# Altium schematic sheet vi_dieu_khien.SchDoc
size B; SheetNumber: 2; SheetTotal: 3
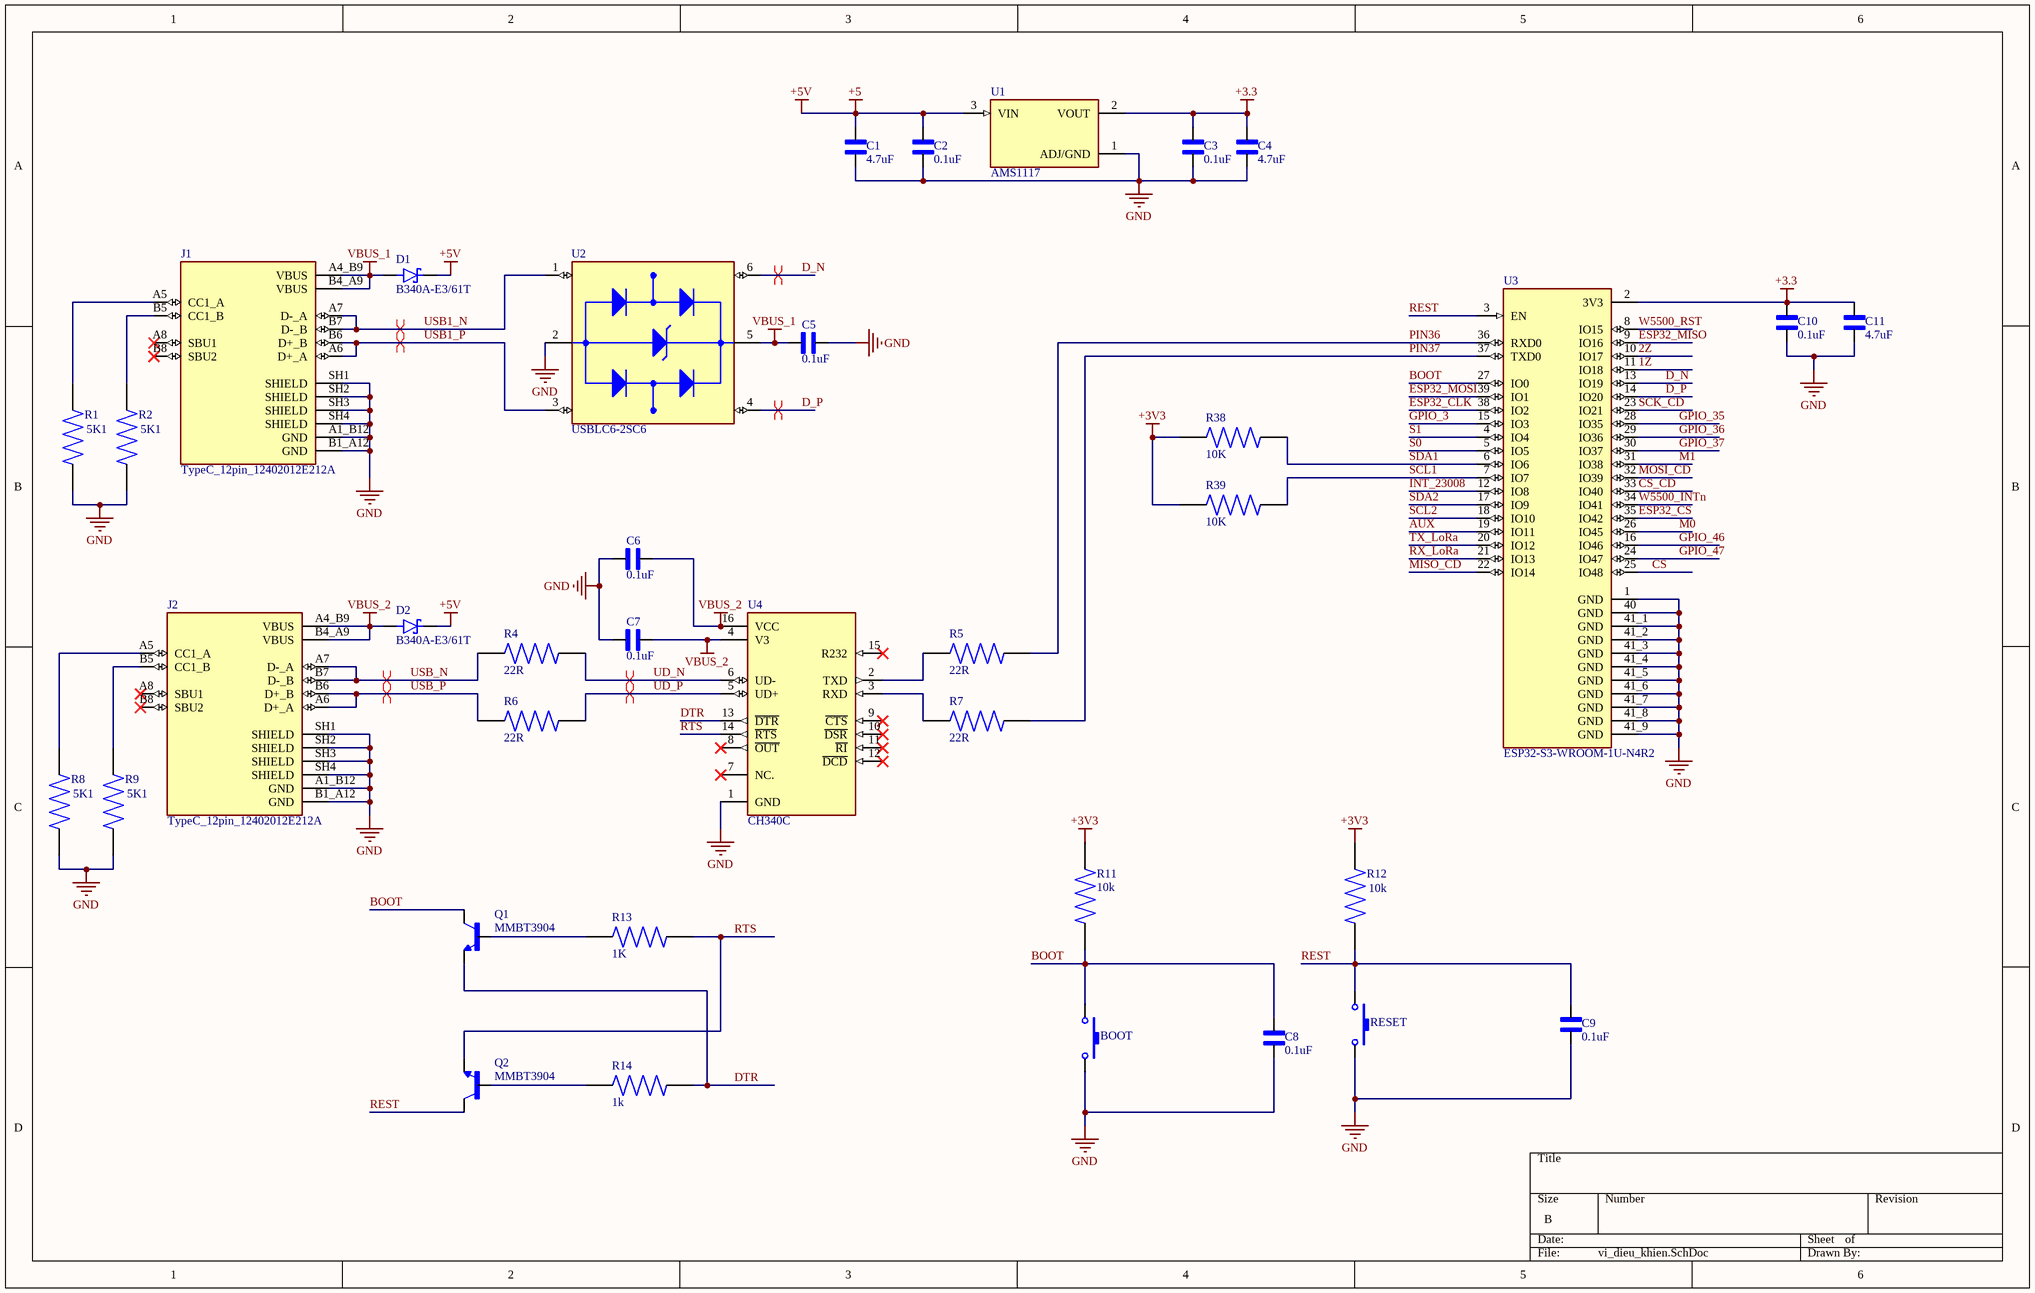
[diagram p0: vi_dieu_khien.SchDoc]

## Parts
BOOT  Nut Nhan 2 Chan SMD 3x6x2.5  [PCBComponent_1]  (value not drawn)
C1  4.7uF  [CAPC1608X94N]
C2  0.1uF  [CAPC1608X94N]
C3  0.1uF  [CAPC1608X94N]
C4  4.7uF  [CAPC1608X94N]
C5  0.1uF  [CAPC1608X94N]
C6  0.1uF  [CAPC1608X94N]
C7  0.1uF  [CAPC1608X94N]
C8  0.1uF  [CAPC1608X94N]
C9  0.1uF  [CAPC1608X94N]
C10  0.1uF  [CAPC1608X94N]
C11  4.7uF  [CAPC1608X94N]
D1  B340A-E3/61T  [DIOM5126X229N]
D2  B340A-E3/61T  [DIOM5126X229N]
J1  TypeC_12pin_12402012E212A  [TypeC_12pin_12402012E212A]
J2  TypeC_12pin_12402012E212A  [TypeC_12pin_12402012E212A]
Q1  MMBT3904  [TRANS_MMBT3904]
Q2  MMBT3904  [TRANS_MMBT3904]
R1  5K1  [RES_ERJU03J474V]
R2  5K1  [RES_ERJU03J474V]
R4  22R  [RES_ERJU03J474V]
R5  22R  [RES_ERJU03J474V]
R6  22R  [RES_ERJU03J474V]
R7  22R  [RES_ERJU03J474V]
R8  5K1  [RES_ERJU03J474V]
R9  5K1  [RES_ERJU03J474V]
R11  10k  [RES_ERJU03J474V]
R12  10k  [RES_ERJU03J474V]
R13  1K  [RES_ERJU03J474V]
R14  1k  [RES_ERJU03J474V]
R38  10K  [RES_ERJU03J474V]
R39  10K  [RES_ERJU03J474V]
RESET  Nut Nhan 2 Chan SMD 3x6x2.5  [PCBComponent_1]  (value not drawn)
U1  AMS1117  [SOT229P700X180-4N]
U2  USBLC6-2SC6  [USBLC6-2SC6]
U3  ESP32-S3-WROOM-1U-N4R2  [XCVR_ESP32-S3-WROOM-1U-N4R2]
U4  CH340C  [CH340C]

## Nets
+3.3: C3.2 C4.2 C10.2 C11.2 U1.2(VOUT) U3.2(3V3)
+3V3: R11.1 R12.1 R38.2 R39.2
+5: C1.2 C2.2 D1.C D2.C U1.3(VIN)  [also labelled +5V]
GND: BOOT.2 C1.1 C2.1 C3.1 C4.1 C5.1 C6.1 C7.1 C8.2 C9.2 C10.1 C11.1 J1.A1_B12(GND) J1.B1_A12(GND) J1.SH1(SHIELD) J1.SH2(SHIELD) J1.SH3(SHIELD) J1.SH4(SHIELD) J2.A1_B12(GND) J2.B1_A12(GND) J2.SH1(SHIELD) J2.SH2(SHIELD) J2.SH3(SHIELD) J2.SH4(SHIELD) R1.1 R2.1 R8.1 R9.1 RESET.2 U1.1(ADJ/GND) U2.2(GND) U3.1(GND) U3.40(GND) U3.41_1(GND) U3.41_2(GND) U3.41_3(GND) U3.41_4(GND) U3.41_5(GND) U3.41_6(GND) U3.41_7(GND) U3.41_8(GND) U3.41_9(GND) U4.1(GND)
VBUS_1: C5.2 D1.A J1.A4_B9(VBUS) J1.B4_A9(VBUS) U2.5(VBUS)
VBUS_2: C6.2 C7.2 D2.A J2.A4_B9(VBUS) J2.B4_A9(VBUS) U4.4(V3) U4.16(VCC)
1Z: U3.11(IO18)
2Z: U3.10(IO17)
AUX: U3.19(IO11)
BOOT: BOOT.1 C8.1 Q1.3(C) R11.2 U3.27(IO0)
CS: U3.25(IO48)
CS_CD: U3.33(IO40)
D_N: U2.6(I/O1_OUT) U3.13(IO19)
D_P: U2.4(I/O2_OUT) U3.14(IO20)
DTR: Q1.2(E) R14.2 U4.13(~{DTR})
ESP32_CLK: U3.38(IO2)
ESP32_CS: U3.35(IO42)
ESP32_MISO: U3.9(IO16)
ESP32_MOSI: U3.39(IO1)
GPIO_3: U3.15(IO3)
GPIO_35: U3.28(IO35)
GPIO_36: U3.29(IO36)
GPIO_37: U3.30(IO37)
GPIO_46: U3.16(IO46)
GPIO_47: U3.24(IO47)
INT_23008: U3.12(IO8)
M0: U3.26(IO45)
M1: U3.31(IO38)
MISO_CD: U3.22(IO14)
MOSI_CD: U3.32(IO39)
PIN36: R5.2 U3.36(RXD0)
PIN37: R7.2 U3.37(TXD0)
REST: C9.1 Q2.3(C) R12.2 RESET.1 U3.3(EN)
RTS: Q2.2(E) R13.2 U4.14(~{RTS})
RX_LoRa: U3.21(IO13)
S0: U3.5(IO5)
S1: U3.4(IO4)
SCK_CD: U3.23(IO21)
SCL1: R39.1 U3.7(IO7)
SCL2: U3.18(IO10)
SDA1: R38.1 U3.6(IO6)
SDA2: U3.17(IO9)
TX_LoRa: U3.20(IO12)
UD_N: R4.2 U4.6(UD-)
UD_P: R6.2 U4.5(UD+)
USB1_N: J1.A7(D-_A) J1.B7(D-_B) U2.1(I/O1_IN)
USB1_P: J1.A6(D+_A) J1.B6(D+_B) U2.3(I/O2_IN)
USB_N: J2.A7(D-_A) J2.B7(D-_B) R4.1
USB_P: J2.A6(D+_A) J2.B6(D+_B) R6.1
W5500_INTn: U3.34(IO41)
W5500_RST: U3.8(IO15)
NetJ1_A5: J1.A5(CC1_A) R1.2
NetJ1_B5: J1.B5(CC1_B) R2.2
NetJ2_A5: J2.A5(CC1_A) R8.2
NetJ2_B5: J2.B5(CC1_B) R9.2
NetQ1_1: Q1.1(B) R13.1
NetQ2_1: Q2.1(B) R14.1
NetR5_1: R5.1 U4.2(TXD)
NetR7_1: R7.1 U4.3(RXD)

Not connected (* = marked no-connect by the designer): J1 A8(SBU1)* B8(SBU2)*; J2 A8(SBU1)* B8(SBU2)*; U4 7(NC.)* 8(~{OUT})* 9(~{CTS})* 10(~{DSR})* 11(~{RI})* 12(~{DCD})* 15(R232)*

## Layout directives
differential pair: D_N, D_P, UD_N, UD_P, USB1_N, USB1_P, USB_N, USB_P

## Library data of the parts
BOOT RESET = Nut Nhan 2 Chan SMD 3x6x2.5: Ma_Hang: MH001036; Ten: Nút Nhấn 2 Chân 3x6x2.5MM SMD
C1-C11 = cap_0603_VJ0603D3R9DXCAP: cap 0603 (1608 Metric); MF: Vishay Vitramon; SnapEDA_Link: https://www.snapeda.com/parts/VJ0603D3R9DXCAP/Vishay/view-part/?ref=snap; Package: 1608 Vishay Vitramon; Value: *; MP: VJ0603D3R9DXCAP; Check_prices: https://www.snapeda.com/parts/VJ0603D3R9DXCAP/Vishay/view-part/?ref=eda
D1 D2 = B340A-E3/61T: Diode Schottky 40 V 3A Surface Mount DO-214AC (SMA); MF: Vishay Semiconductor; SnapEDA_Link: https://www.snapeda.com/parts/B340A-E3/61T/Vishay/view-part/?ref=snap; Package: DO-214 Vishay Semiconductor; Value: *; MP: B340A-E3/61T; Check_prices: https://www.snapeda.com/parts/B340A-E3/61T/Vishay/view-part/?ref=eda
J1 J2 = TypeC_12pin_12402012E212A: USB2.0, Type C, Top mount, CH 1.68mm, Dual Row SMT; MF: Amphenol ICC (Commercial Products); MP: 12402012E212A; Price: None; Package: None; Availability: In Stock; SnapEDA_Link: https://www.snapeda.com/parts/12402012E212A/Amphenol/view-part/?ref=snap; Value: *; Check_prices: https://www.snapeda.com/parts/12402012E212A/Amphenol/view-part/?ref=eda; Purchase-URL: https://pricing.snapeda.com/search/part/12402012E212A/?ref=eda
Q1 Q2 = MMBT3904: BJT, SOT-23, 40V, 200mA, NPN, 0.35W, 150Â°C; MF: Diotec Semiconductor; SnapEDA_Link: https://www.snapeda.com/parts/MMBT3904/Diotec/view-part/?ref=snap; Package: SOT-23 Diotec; Value: *; MP: MMBT3904; Check_prices: https://www.snapeda.com/parts/MMBT3904/Diotec/view-part/?ref=eda
R1 R2 R4-R9 R11-R14 R38 R39 = res_0603_ERJU03J474V: 0603 Anti-Sulfurated; MF: Panasonic; SnapEDA_Link: https://www.snapeda.com/parts/ERJU03J474V/Panasonic/view-part/?ref=snap; Package: 1608-2 Panasonic; Value: *; MP: ERJU03J474V; Check_prices: https://www.snapeda.com/parts/ERJU03J474V/Panasonic/view-part/?ref=eda
U1 = AMS1117: 1A LOW DROPOUT VOLTAGE REGULATOR SOT-223; MF: Advanced Monolithic Systems; SnapEDA_Link: https://www.snapeda.com/parts/AMS1117/Advanced+Monolithic+Systems/view-part/?ref=snap; Package: SOT-223 Seeed Technology; Value: *; MP: AMS1117; Check_prices: https://www.snapeda.com/parts/AMS1117/Advanced+Monolithic+Systems/view-part/?ref=eda
U2 = USBLC6-2SC6: 17V Clamp 5A (8/20Âµs) Ipp Tvs Diode Surface Mount SOT-23-6; MF: STMicroelectronics; Value: *; SnapEDA_Link: https://www.snapeda.com/parts/USBLC6-2SC6/STMicroelectronics/view-part/?ref=snap; Check_prices: https://www.snapeda.com/parts/USBLC6-2SC6/STMicroelectronics/view-part/?ref=eda; Purchase-URL: https://pricing.snapeda.com/search/part/USBLC6-2SC6/?ref=eda; Price: None; Availability: In Stock; Package: SOT-23-6 STMicroelectronics; MP: USBLC6-2SC6
U3 = ESP32-S3-WROOM-1U-N4R2: MF: {'manufacturer': u'Espressif Systems'}; Package: None; Price: None; Value: *; MP: ESP32-S3-WROOM-1U-N4R2; Availability: Unavailable
U4 = CH340C: USB to serial chip CH340; MF: WCH; Price: None; Availability: Not in stock; MP: CH340C; Package: None; SnapEDA_Link: https://www.snapeda.com/parts/CH340C/WCH/view-part/?ref=snap; Check_prices: https://www.snapeda.com/parts/CH340C/WCH/view-part/?ref=eda; Value: *